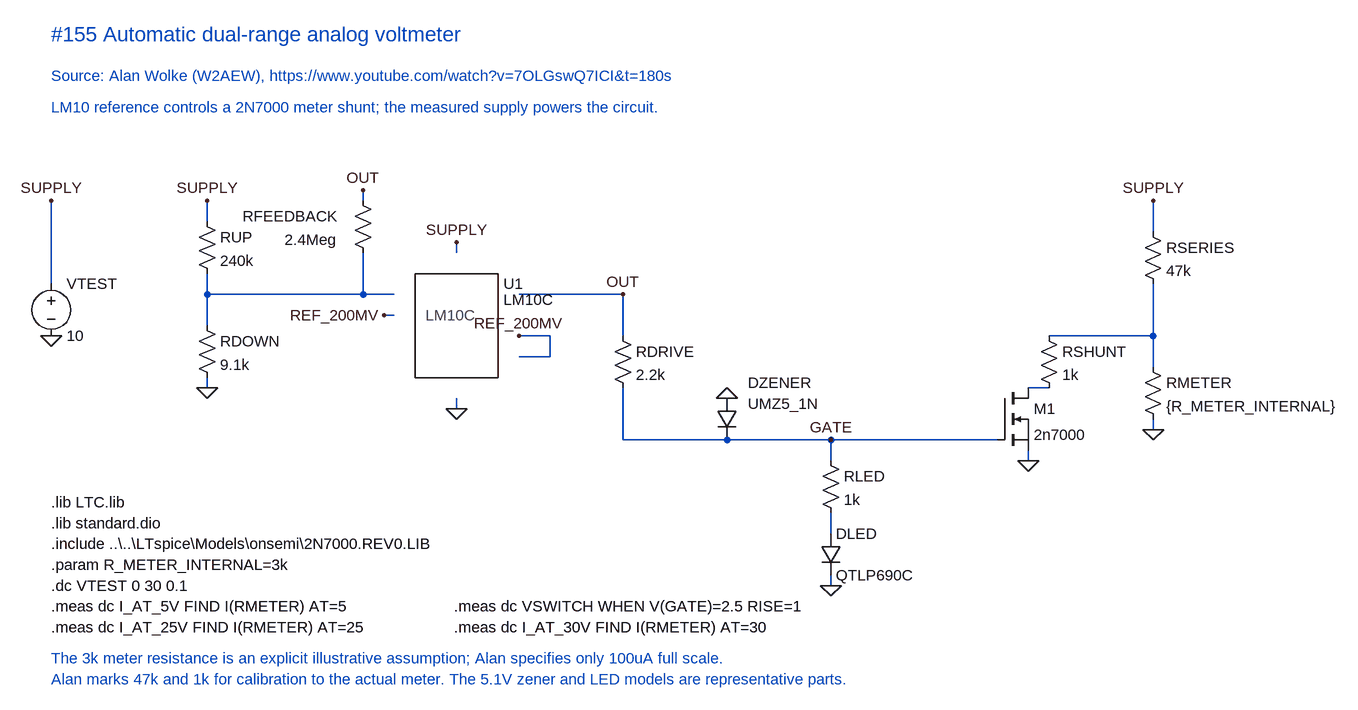
[diagram p0: schematic Automatic dual-range voltmeter.asc]
Automatic dual-range voltmeter.asc, the LTspice schematic file:
Version 4
SHEET 1 2200 1150
WIRE 80 160 80 288
WIRE 320 160 320 192
WIRE 320 272 320 304
WIRE 320 304 320 352
WIRE 320 304 560 304
WIRE 560 240 560 304
WIRE 560 304 608 304
WIRE 320 432 320 448
WIRE 560 160 560 144
WIRE 704 224 704 240
WIRE 704 464 704 480
WIRE 800 304 960 304
WIRE 960 304 960 368
WIRE 608 336 592 336
WIRE 800 368 848 368
WIRE 848 368 848 400
WIRE 848 400 800 400
WIRE 960 448 960 528
WIRE 960 528 1120 528
WIRE 1120 528 1280 528
WIRE 1280 528 1536 528
WIRE 1280 528 1280 560
WIRE 1280 640 1280 672
WIRE 1584 448 1616 448
WIRE 1776 160 1776 208
WIRE 1616 368 1776 368
WIRE 1776 288 1776 368
WIRE 1776 368 1776 416
WIRE 1776 496 1776 512
WIRE 1584 544 1584 560
WIRE 1280 736 1280 752
FLAG 80 160 SUPPLY
FLAG 80 368 0
FLAG 320 160 SUPPLY
FLAG 320 448 0
FLAG 560 144 OUT
FLAG 704 224 SUPPLY
FLAG 704 480 0
FLAG 592 336 REF_200MV
FLAG 800 368 REF_200MV
FLAG 960 304 OUT
FLAG 1120 464 0
FLAG 1280 752 0
FLAG 1584 560 0
FLAG 1776 160 SUPPLY
FLAG 1776 512 0
FLAG 1280 528 GATE
SYMBOL voltage 80 272 R0
SYMATTR InstName VTEST
SYMATTR Value 10
SYMBOL res 304 176 R0
SYMATTR InstName RUP
SYMATTR Value 240k
SYMBOL res 304 336 R0
SYMATTR InstName RDOWN
SYMATTR Value 9.1k
SYMBOL res 544 144 R0
WINDOW 0 -24 40 Right 2
WINDOW 3 -24 76 Right 2
SYMATTR InstName RFEEDBACK
SYMATTR Value 2.4Meg
SYMBOL ..\..\LTspice\Symbols\LM10C-combined 704 352 R0
SYMATTR InstName U1
SYMATTR Value LM10C
SYMBOL res 944 352 R0
SYMATTR InstName RDRIVE
SYMATTR Value 2.2k
SYMBOL diode 1104 464 R0
WINDOW 0 48 -24 Left 2
WINDOW 3 48 8 Left 2
SYMATTR InstName DZENER
SYMATTR Value UMZ5_1N
SYMBOL res 1264 544 R0
SYMATTR InstName RLED
SYMATTR Value 1k
SYMBOL diode 1264 672 R0
SYMATTR InstName DLED
SYMATTR Value QTLP690C
SYMBOL nmos 1536 448 R0
SYMATTR InstName M1
SYMATTR Prefix X
SYMATTR Value 2n7000
SYMBOL res 1600 352 R0
SYMATTR InstName RSHUNT
SYMATTR Value 1k
SYMBOL res 1760 192 R0
SYMATTR InstName RSERIES
SYMATTR Value 47k
SYMBOL res 1760 400 R0
SYMATTR InstName RMETER
SYMATTR Value {R_METER_INTERNAL}
TEXT 80 -96 Left 3 ;#155 Automatic dual-range analog voltmeter
TEXT 80 -32 Left 2 ;Source: Alan Wolke (W2AEW), https://www.youtube.com/watch?v=7OLGswQ7ICI&t=180s
TEXT 80 16 Left 2 ;LM10 reference controls a 2N7000 meter shunt; the measured supply powers the circuit.
TEXT 80 624 Left 2 !.lib LTC.lib
TEXT 80 656 Left 2 !.lib standard.dio
TEXT 80 688 Left 2 !.include ..\..\LTspice\Models\onsemi\2N7000.REV0.LIB
TEXT 80 720 Left 2 !.param R_METER_INTERNAL=3k
TEXT 80 752 Left 2 !.dc VTEST 0 30 0.1
TEXT 80 784 Left 2 !.meas dc I_AT_5V FIND I(RMETER) AT=5
TEXT 80 816 Left 2 !.meas dc I_AT_25V FIND I(RMETER) AT=25
TEXT 700 784 Left 2 !.meas dc VSWITCH WHEN V(GATE)=2.5 RISE=1
TEXT 700 816 Left 2 !.meas dc I_AT_30V FIND I(RMETER) AT=30
TEXT 80 864 Left 2 ;The 3k meter resistance is an explicit illustrative assumption; Alan specifies only 100uA full scale.
TEXT 80 896 Left 2 ;Alan marks 47k and 1k for calibration to the actual meter. The 5.1V zener and LED models are representative parts.

The netlist it stands for:
* Automatic dual-range voltmeter.asc
VTEST SUPPLY 0 10
RUP SUPPLY N001 240k
RDOWN N001 0 9.1k
RFEEDBACK OUT N001 2.4Meg
XU1 N001 REF_200MV SUPPLY 0 OUT REF_200MV REF_200MV LM10C  ; pins IN+_(3) IN-_(2) V+_(7) V-_(4) OUT_(6) REFOUT_(1) REFFB_(8)
RDRIVE OUT GATE 2.2k
DZENER 0 GATE UMZ5_1N
RLED GATE N002 1k
DLED N002 0 QTLP690C
XM1 N003 GATE 0 2n7000  ; pins D G S
RSHUNT N004 N003 1k
RSERIES SUPPLY N004 47k
RMETER N004 0 {R_METER_INTERNAL}
.model D D
.lib standard.dio
* #155 Automatic dual-range analog voltmeter
* Source: Alan Wolke (W2AEW), https://www.youtube.com/watch?v=7OLGswQ7ICI&t=180s
* LM10 reference controls a 2N7000 meter shunt; the measured supply powers the circuit.
.lib LTC.lib
.lib standard.dio
.include ..\..\LTspice\Models\onsemi\2N7000.REV0.LIB
.param R_METER_INTERNAL=3k
.dc VTEST 0 30 0.1
.meas dc I_AT_5V FIND I(RMETER) AT=5
.meas dc I_AT_25V FIND I(RMETER) AT=25
.meas dc VSWITCH WHEN V(GATE)=2.5 RISE=1
.meas dc I_AT_30V FIND I(RMETER) AT=30
* The 3k meter resistance is an explicit illustrative assumption; Alan specifies only 100uA full scale.
* Alan marks 47k and 1k for calibration to the actual meter. The 5.1V zener and LED models are representative parts.
.backanno
.end